# Altium schematic sheet Top_Level.SchDoc: Hierarquia geral / Projeto 3
size 584 x 419 mm; Project: CM5 Photonic Bias Controller; DocumentRev: R5; ProjectRev: R5; Version: Rev R6; SheetNumber: 1; SheetTotal: 17; Author: Carlos Renan; SCH_SCALE: N/A; Address1: UFCG; Address2: Referencia: VIRTUS CC; Address3: Campina Grande - PB; ProjectName: Controle automatico de BIAS para MZM/IQ - Projeto 3; DocumentName: Top_Level.SchDoc
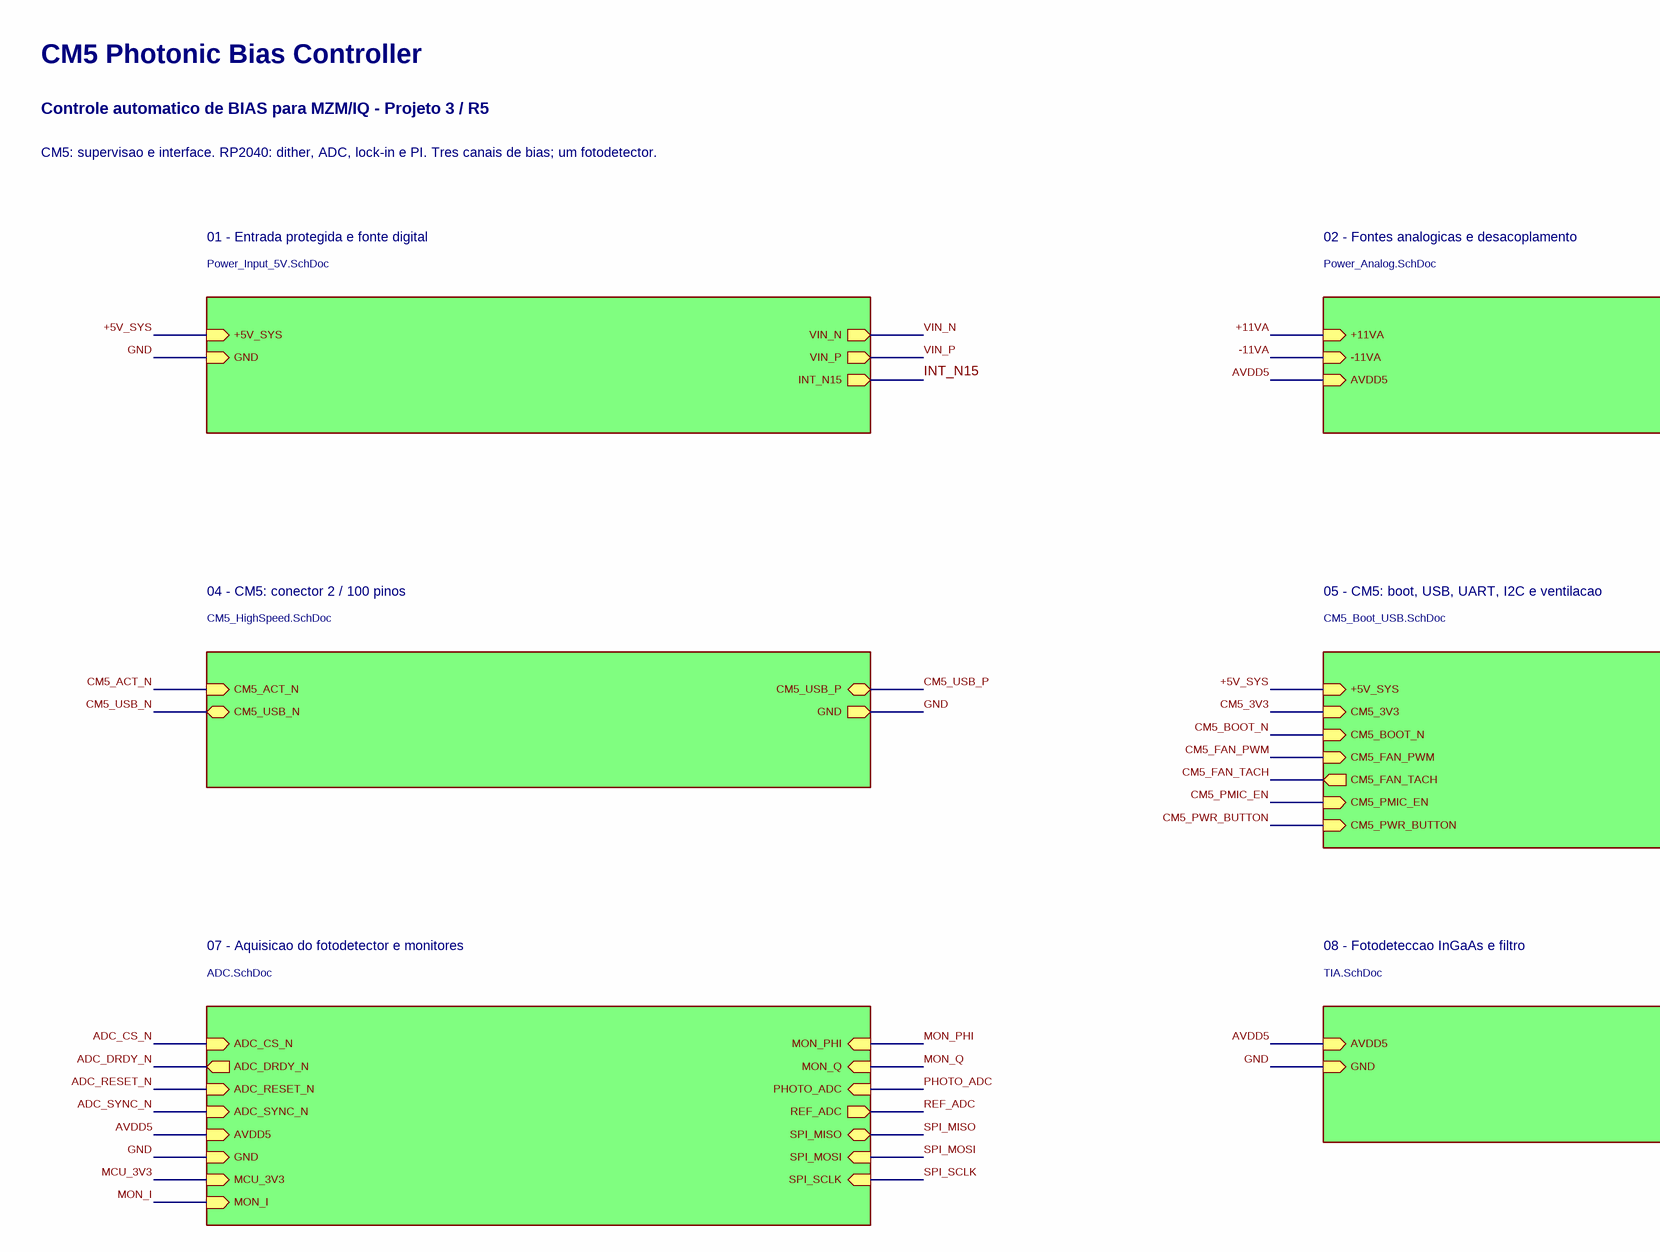
[diagram p0: Top_Level.SchDoc, top left]
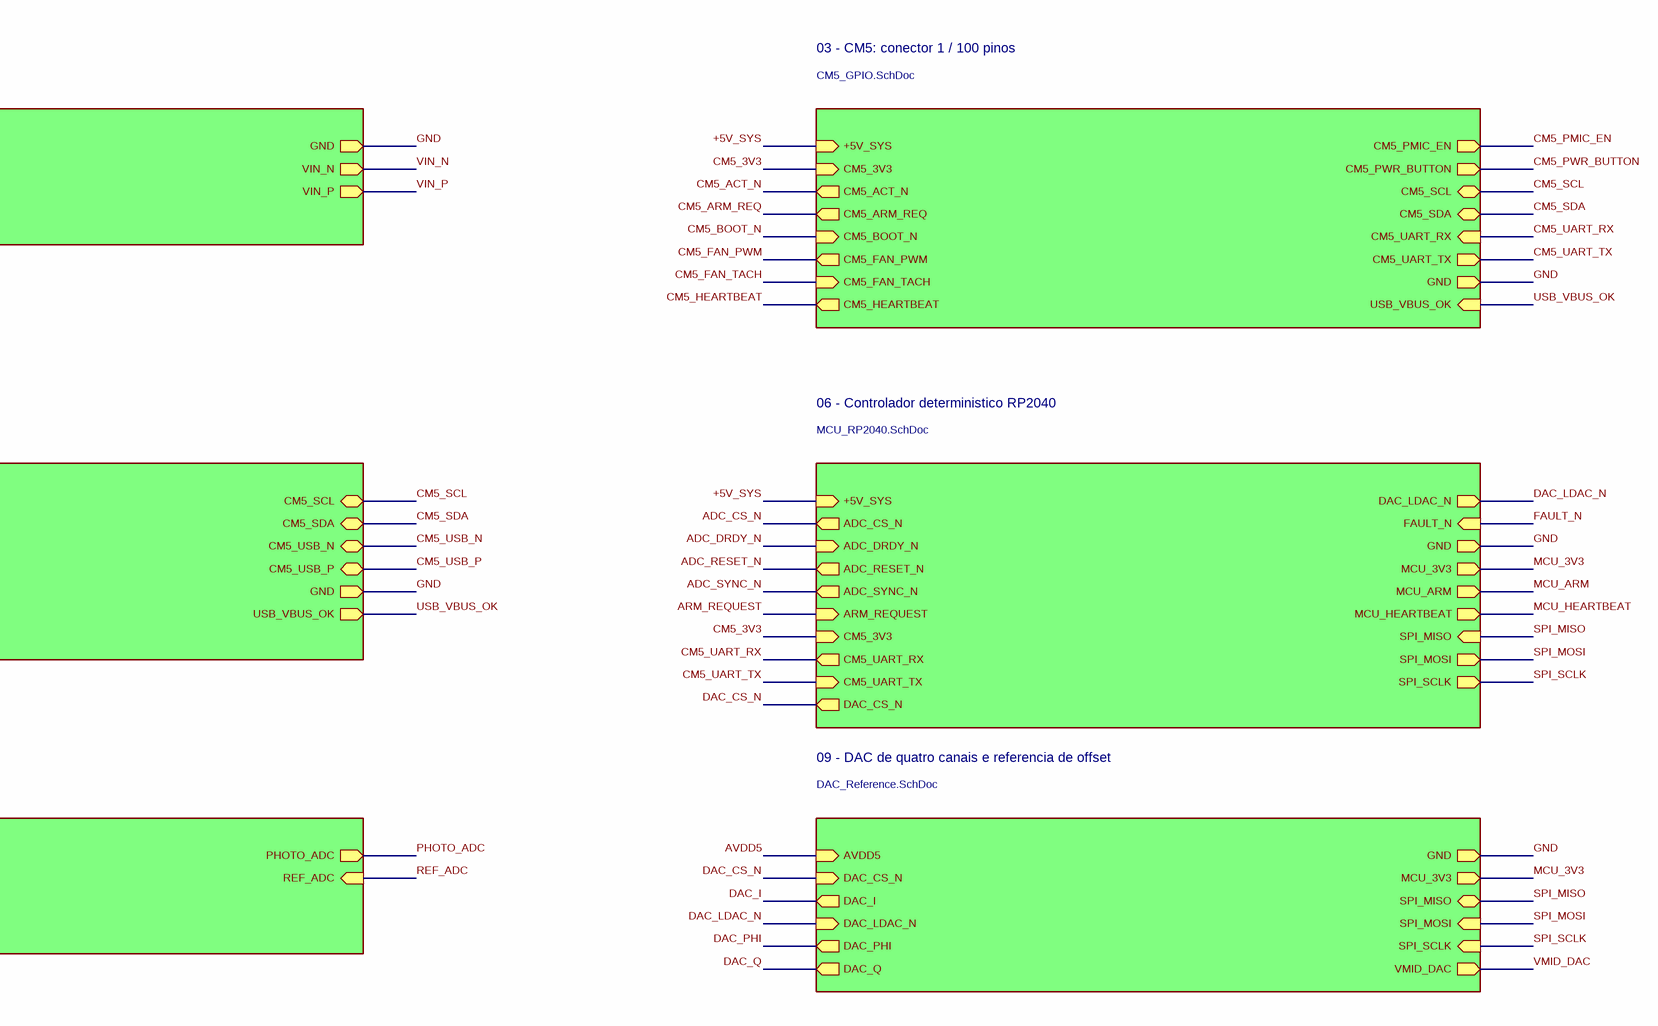
[diagram p1: Top_Level.SchDoc, top right]
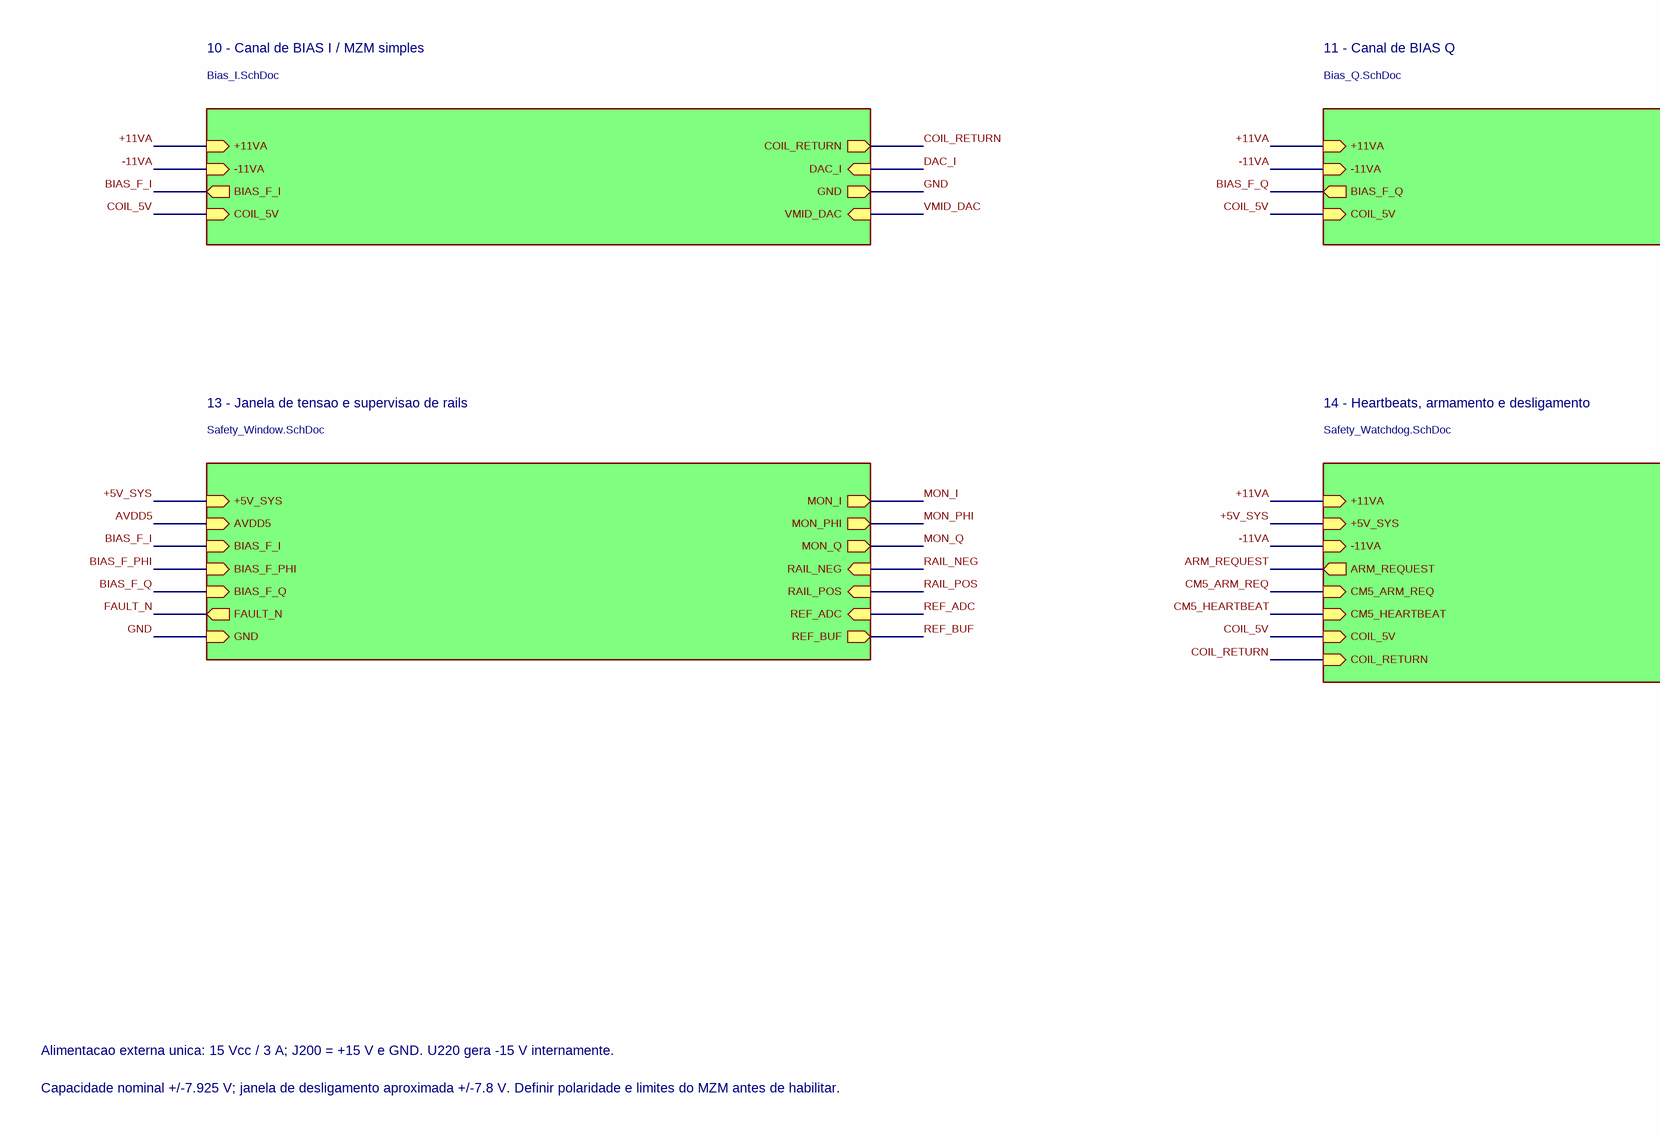
[diagram p2: Top_Level.SchDoc, bottom left]
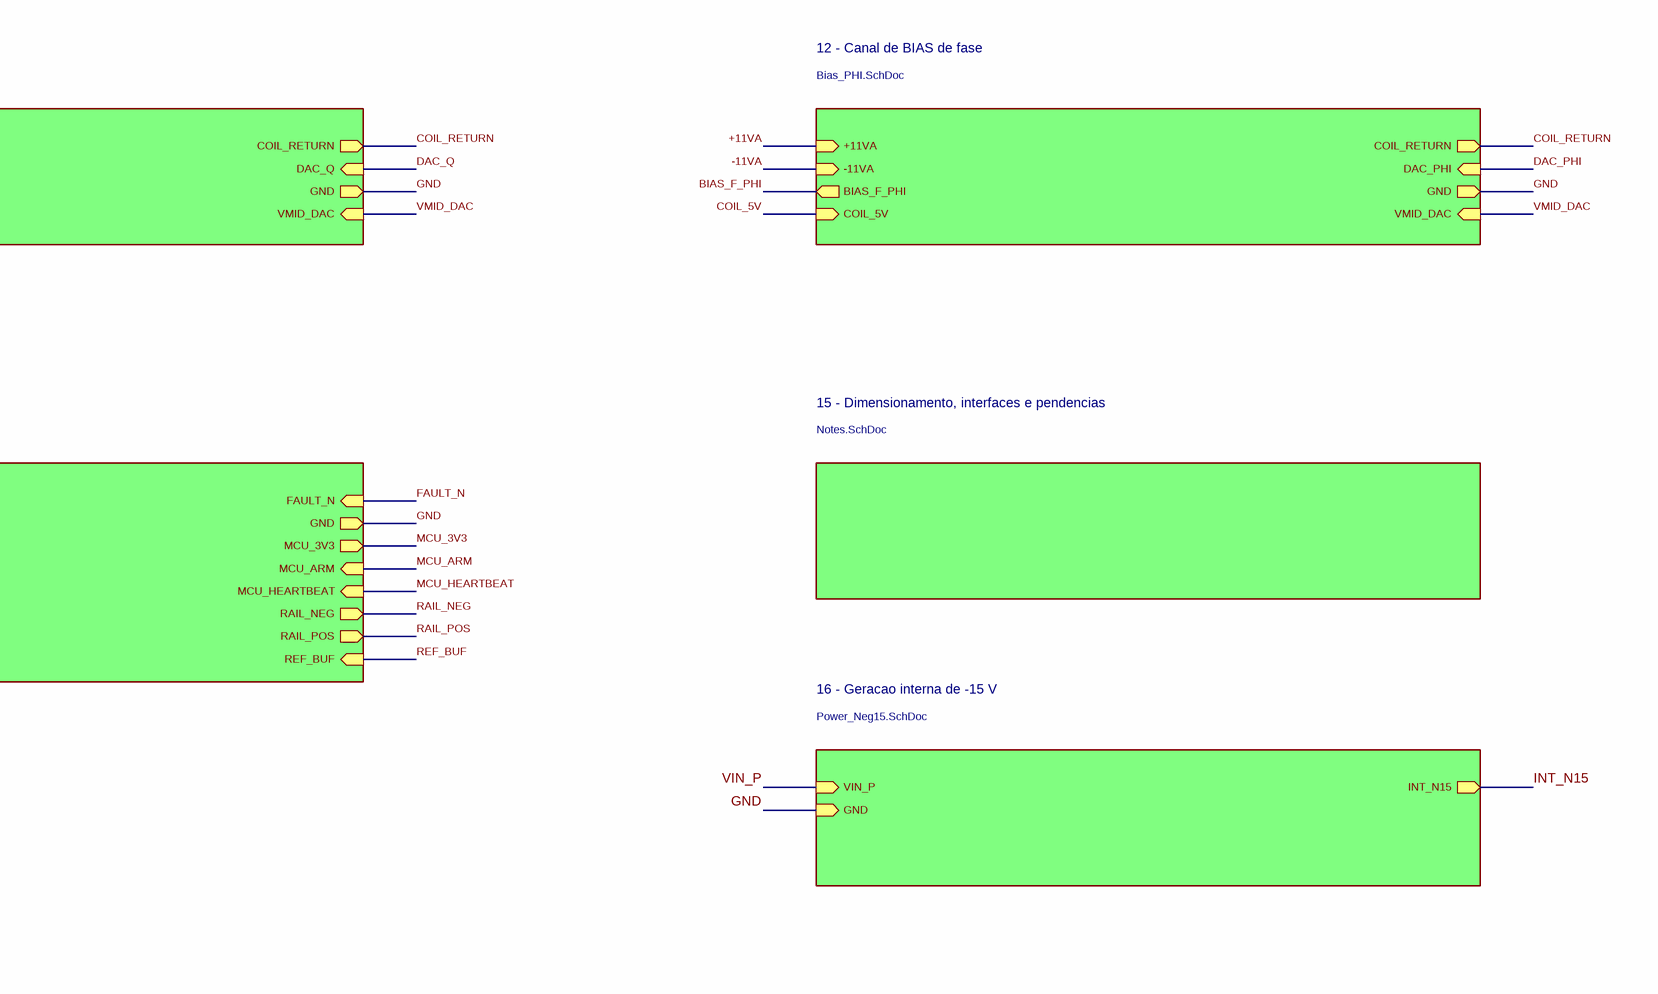
[diagram p3: Top_Level.SchDoc, bottom right]

## Sub-sheets
01 - Entrada protegida e fonte digital = Power_Input_5V.SchDoc: +5V_SYS, GND, VIN_N, VIN_P, INT_N15
02 - Fontes analogicas e desacoplamento = Power_Analog.SchDoc: +11VA, -11VA, AVDD5, GND, VIN_N, VIN_P
03 - CM5: conector 1 / 100 pinos = CM5_GPIO.SchDoc: +5V_SYS, CM5_3V3, CM5_ACT_N (out), CM5_ARM_REQ (out), CM5_BOOT_N, CM5_FAN_PWM (out), CM5_FAN_TACH (in), CM5_HEARTBEAT (out), CM5_PMIC_EN, CM5_PWR_BUTTON, CM5_SCL (bidir), CM5_SDA (bidir), CM5_UART_RX (in), CM5_UART_TX (out), GND, USB_VBUS_OK (in)
04 - CM5: conector 2 / 100 pinos = CM5_HighSpeed.SchDoc: CM5_ACT_N (in), CM5_USB_N (bidir), CM5_USB_P (bidir), GND
05 - CM5: boot, USB, UART, I2C e ventilacao = CM5_Boot_USB.SchDoc: +5V_SYS, CM5_3V3, CM5_BOOT_N, CM5_FAN_PWM (in), CM5_FAN_TACH (out), CM5_PMIC_EN, CM5_PWR_BUTTON, CM5_SCL (bidir), CM5_SDA (bidir), CM5_USB_N (bidir), CM5_USB_P (bidir), GND, USB_VBUS_OK (out)
06 - Controlador deterministico RP2040 = MCU_RP2040.SchDoc: +5V_SYS, ADC_CS_N (out), ADC_DRDY_N (in), ADC_RESET_N (out), ADC_SYNC_N (out), ARM_REQUEST (in), CM5_3V3, CM5_UART_RX (out), CM5_UART_TX (in), DAC_CS_N (out), DAC_LDAC_N (out), FAULT_N (in), GND, MCU_3V3, MCU_ARM (out), MCU_HEARTBEAT (out), SPI_MISO (in), SPI_MOSI (out), SPI_SCLK (out)
07 - Aquisicao do fotodetector e monitores = ADC.SchDoc: ADC_CS_N (in), ADC_DRDY_N (out), ADC_RESET_N (in), ADC_SYNC_N (in), AVDD5, GND, MCU_3V3, MON_I (in), MON_PHI (in), MON_Q (in), PHOTO_ADC (in), REF_ADC (out), SPI_MISO (bidir), SPI_MOSI (in), SPI_SCLK (in)
08 - Fotodeteccao InGaAs e filtro = TIA.SchDoc: AVDD5, GND, PHOTO_ADC (out), REF_ADC (in)
09 - DAC de quatro canais e referencia de offset = DAC_Reference.SchDoc: AVDD5, DAC_CS_N (in), DAC_I (out), DAC_LDAC_N (in), DAC_PHI (out), DAC_Q (out), GND, MCU_3V3, SPI_MISO (bidir), SPI_MOSI (in), SPI_SCLK (in), VMID_DAC (out)
10 - Canal de BIAS I / MZM simples = Bias_I.SchDoc: +11VA, -11VA, BIAS_F_I (out), COIL_5V, COIL_RETURN, DAC_I (in), GND, VMID_DAC (in)
11 - Canal de BIAS Q = Bias_Q.SchDoc: +11VA, -11VA, BIAS_F_Q (out), COIL_5V, COIL_RETURN, DAC_Q (in), GND, VMID_DAC (in)
12 - Canal de BIAS de fase = Bias_PHI.SchDoc: +11VA, -11VA, BIAS_F_PHI (out), COIL_5V, COIL_RETURN, DAC_PHI (in), GND, VMID_DAC (in)
13 - Janela de tensao e supervisao de rails = Safety_Window.SchDoc: +5V_SYS, AVDD5, BIAS_F_I (in), BIAS_F_PHI (in), BIAS_F_Q (in), FAULT_N (out), GND, MON_I (out), MON_PHI (out), MON_Q (out), RAIL_NEG (in), RAIL_POS (in), REF_ADC (in), REF_BUF (out)
14 - Heartbeats, armamento e desligamento = Safety_Watchdog.SchDoc: +11VA, +5V_SYS, -11VA, ARM_REQUEST (out), CM5_ARM_REQ (in), CM5_HEARTBEAT (in), COIL_5V, COIL_RETURN, FAULT_N (in), GND, MCU_3V3, MCU_ARM (in), MCU_HEARTBEAT (in), RAIL_NEG (out), RAIL_POS (out), REF_BUF (in)
15 - Dimensionamento, interfaces e pendencias = Notes.SchDoc: no entries
16 - Geracao interna de -15 V = Power_Neg15.SchDoc: VIN_P, GND, INT_N15

## Nets
+5V_SYS: sheet 01 - Entrada protegida e fonte digital/+5V_SYS, sheet 03 - CM5: conector 1 / 100 pinos/+5V_SYS, sheet 05 - CM5: boot, USB, UART, I2C e ventilacao/+5V_SYS, sheet 06 - Controlador deterministico RP2040/+5V_SYS, sheet 13 - Janela de tensao e supervisao de rails/+5V_SYS, sheet 14 - Heartbeats, armamento e desligamento/+5V_SYS
+11VA: sheet 02 - Fontes analogicas e desacoplamento/+11VA, sheet 10 - Canal de BIAS I / MZM simples/+11VA, sheet 11 - Canal de BIAS Q/+11VA, sheet 12 - Canal de BIAS de fase/+11VA, sheet 14 - Heartbeats, armamento e desligamento/+11VA
-11VA: sheet 02 - Fontes analogicas e desacoplamento/-11VA, sheet 10 - Canal de BIAS I / MZM simples/-11VA, sheet 11 - Canal de BIAS Q/-11VA, sheet 12 - Canal de BIAS de fase/-11VA, sheet 14 - Heartbeats, armamento e desligamento/-11VA
ADC_CS_N: sheet 06 - Controlador deterministico RP2040/ADC_CS_N, sheet 07 - Aquisicao do fotodetector e monitores/ADC_CS_N
ADC_DRDY_N: sheet 06 - Controlador deterministico RP2040/ADC_DRDY_N, sheet 07 - Aquisicao do fotodetector e monitores/ADC_DRDY_N
ADC_RESET_N: sheet 06 - Controlador deterministico RP2040/ADC_RESET_N, sheet 07 - Aquisicao do fotodetector e monitores/ADC_RESET_N
ADC_SYNC_N: sheet 06 - Controlador deterministico RP2040/ADC_SYNC_N, sheet 07 - Aquisicao do fotodetector e monitores/ADC_SYNC_N
ARM_REQUEST: sheet 06 - Controlador deterministico RP2040/ARM_REQUEST, sheet 14 - Heartbeats, armamento e desligamento/ARM_REQUEST
AVDD5: sheet 02 - Fontes analogicas e desacoplamento/AVDD5, sheet 07 - Aquisicao do fotodetector e monitores/AVDD5, sheet 08 - Fotodeteccao InGaAs e filtro/AVDD5, sheet 09 - DAC de quatro canais e referencia de offset/AVDD5, sheet 13 - Janela de tensao e supervisao de rails/AVDD5
BIAS_F_I: sheet 10 - Canal de BIAS I / MZM simples/BIAS_F_I, sheet 13 - Janela de tensao e supervisao de rails/BIAS_F_I
BIAS_F_PHI: sheet 12 - Canal de BIAS de fase/BIAS_F_PHI, sheet 13 - Janela de tensao e supervisao de rails/BIAS_F_PHI
BIAS_F_Q: sheet 11 - Canal de BIAS Q/BIAS_F_Q, sheet 13 - Janela de tensao e supervisao de rails/BIAS_F_Q
CM5_3V3: sheet 03 - CM5: conector 1 / 100 pinos/CM5_3V3, sheet 05 - CM5: boot, USB, UART, I2C e ventilacao/CM5_3V3, sheet 06 - Controlador deterministico RP2040/CM5_3V3
CM5_ACT_N: sheet 03 - CM5: conector 1 / 100 pinos/CM5_ACT_N, sheet 04 - CM5: conector 2 / 100 pinos/CM5_ACT_N
CM5_ARM_REQ: sheet 03 - CM5: conector 1 / 100 pinos/CM5_ARM_REQ, sheet 14 - Heartbeats, armamento e desligamento/CM5_ARM_REQ
CM5_BOOT_N: sheet 03 - CM5: conector 1 / 100 pinos/CM5_BOOT_N, sheet 05 - CM5: boot, USB, UART, I2C e ventilacao/CM5_BOOT_N
CM5_FAN_PWM: sheet 03 - CM5: conector 1 / 100 pinos/CM5_FAN_PWM, sheet 05 - CM5: boot, USB, UART, I2C e ventilacao/CM5_FAN_PWM
CM5_FAN_TACH: sheet 03 - CM5: conector 1 / 100 pinos/CM5_FAN_TACH, sheet 05 - CM5: boot, USB, UART, I2C e ventilacao/CM5_FAN_TACH
CM5_HEARTBEAT: sheet 03 - CM5: conector 1 / 100 pinos/CM5_HEARTBEAT, sheet 14 - Heartbeats, armamento e desligamento/CM5_HEARTBEAT
CM5_PMIC_EN: sheet 03 - CM5: conector 1 / 100 pinos/CM5_PMIC_EN, sheet 05 - CM5: boot, USB, UART, I2C e ventilacao/CM5_PMIC_EN
CM5_PWR_BUTTON: sheet 03 - CM5: conector 1 / 100 pinos/CM5_PWR_BUTTON, sheet 05 - CM5: boot, USB, UART, I2C e ventilacao/CM5_PWR_BUTTON
CM5_SCL: sheet 03 - CM5: conector 1 / 100 pinos/CM5_SCL, sheet 05 - CM5: boot, USB, UART, I2C e ventilacao/CM5_SCL
CM5_SDA: sheet 03 - CM5: conector 1 / 100 pinos/CM5_SDA, sheet 05 - CM5: boot, USB, UART, I2C e ventilacao/CM5_SDA
CM5_UART_RX: sheet 03 - CM5: conector 1 / 100 pinos/CM5_UART_RX, sheet 06 - Controlador deterministico RP2040/CM5_UART_RX
CM5_UART_TX: sheet 03 - CM5: conector 1 / 100 pinos/CM5_UART_TX, sheet 06 - Controlador deterministico RP2040/CM5_UART_TX
CM5_USB_N: sheet 04 - CM5: conector 2 / 100 pinos/CM5_USB_N, sheet 05 - CM5: boot, USB, UART, I2C e ventilacao/CM5_USB_N
CM5_USB_P: sheet 04 - CM5: conector 2 / 100 pinos/CM5_USB_P, sheet 05 - CM5: boot, USB, UART, I2C e ventilacao/CM5_USB_P
COIL_5V: sheet 10 - Canal de BIAS I / MZM simples/COIL_5V, sheet 11 - Canal de BIAS Q/COIL_5V, sheet 12 - Canal de BIAS de fase/COIL_5V, sheet 14 - Heartbeats, armamento e desligamento/COIL_5V
COIL_RETURN: sheet 10 - Canal de BIAS I / MZM simples/COIL_RETURN, sheet 11 - Canal de BIAS Q/COIL_RETURN, sheet 12 - Canal de BIAS de fase/COIL_RETURN, sheet 14 - Heartbeats, armamento e desligamento/COIL_RETURN
DAC_CS_N: sheet 06 - Controlador deterministico RP2040/DAC_CS_N, sheet 09 - DAC de quatro canais e referencia de offset/DAC_CS_N
DAC_I: sheet 09 - DAC de quatro canais e referencia de offset/DAC_I, sheet 10 - Canal de BIAS I / MZM simples/DAC_I
DAC_LDAC_N: sheet 06 - Controlador deterministico RP2040/DAC_LDAC_N, sheet 09 - DAC de quatro canais e referencia de offset/DAC_LDAC_N
DAC_PHI: sheet 09 - DAC de quatro canais e referencia de offset/DAC_PHI, sheet 12 - Canal de BIAS de fase/DAC_PHI
DAC_Q: sheet 09 - DAC de quatro canais e referencia de offset/DAC_Q, sheet 11 - Canal de BIAS Q/DAC_Q
FAULT_N: sheet 06 - Controlador deterministico RP2040/FAULT_N, sheet 13 - Janela de tensao e supervisao de rails/FAULT_N, sheet 14 - Heartbeats, armamento e desligamento/FAULT_N
GND: sheet 01 - Entrada protegida e fonte digital/GND, sheet 02 - Fontes analogicas e desacoplamento/GND, sheet 03 - CM5: conector 1 / 100 pinos/GND, sheet 04 - CM5: conector 2 / 100 pinos/GND, sheet 05 - CM5: boot, USB, UART, I2C e ventilacao/GND, sheet 06 - Controlador deterministico RP2040/GND, sheet 07 - Aquisicao do fotodetector e monitores/GND, sheet 08 - Fotodeteccao InGaAs e filtro/GND, sheet 09 - DAC de quatro canais e referencia de offset/GND, sheet 10 - Canal de BIAS I / MZM simples/GND, sheet 11 - Canal de BIAS Q/GND, sheet 12 - Canal de BIAS de fase/GND, sheet 13 - Janela de tensao e supervisao de rails/GND, sheet 14 - Heartbeats, armamento e desligamento/GND, sheet 16 - Geracao interna de -15 V/GND
INT_N15: sheet 01 - Entrada protegida e fonte digital/INT_N15, sheet 16 - Geracao interna de -15 V/INT_N15
MCU_3V3: sheet 06 - Controlador deterministico RP2040/MCU_3V3, sheet 07 - Aquisicao do fotodetector e monitores/MCU_3V3, sheet 09 - DAC de quatro canais e referencia de offset/MCU_3V3, sheet 14 - Heartbeats, armamento e desligamento/MCU_3V3
MCU_ARM: sheet 06 - Controlador deterministico RP2040/MCU_ARM, sheet 14 - Heartbeats, armamento e desligamento/MCU_ARM
MCU_HEARTBEAT: sheet 06 - Controlador deterministico RP2040/MCU_HEARTBEAT, sheet 14 - Heartbeats, armamento e desligamento/MCU_HEARTBEAT
MON_I: sheet 07 - Aquisicao do fotodetector e monitores/MON_I, sheet 13 - Janela de tensao e supervisao de rails/MON_I
MON_PHI: sheet 07 - Aquisicao do fotodetector e monitores/MON_PHI, sheet 13 - Janela de tensao e supervisao de rails/MON_PHI
MON_Q: sheet 07 - Aquisicao do fotodetector e monitores/MON_Q, sheet 13 - Janela de tensao e supervisao de rails/MON_Q
PHOTO_ADC: sheet 07 - Aquisicao do fotodetector e monitores/PHOTO_ADC, sheet 08 - Fotodeteccao InGaAs e filtro/PHOTO_ADC
RAIL_NEG: sheet 13 - Janela de tensao e supervisao de rails/RAIL_NEG, sheet 14 - Heartbeats, armamento e desligamento/RAIL_NEG
RAIL_POS: sheet 13 - Janela de tensao e supervisao de rails/RAIL_POS, sheet 14 - Heartbeats, armamento e desligamento/RAIL_POS
REF_ADC: sheet 07 - Aquisicao do fotodetector e monitores/REF_ADC, sheet 08 - Fotodeteccao InGaAs e filtro/REF_ADC, sheet 13 - Janela de tensao e supervisao de rails/REF_ADC
REF_BUF: sheet 13 - Janela de tensao e supervisao de rails/REF_BUF, sheet 14 - Heartbeats, armamento e desligamento/REF_BUF
SPI_MISO: sheet 06 - Controlador deterministico RP2040/SPI_MISO, sheet 07 - Aquisicao do fotodetector e monitores/SPI_MISO, sheet 09 - DAC de quatro canais e referencia de offset/SPI_MISO
SPI_MOSI: sheet 06 - Controlador deterministico RP2040/SPI_MOSI, sheet 07 - Aquisicao do fotodetector e monitores/SPI_MOSI, sheet 09 - DAC de quatro canais e referencia de offset/SPI_MOSI
SPI_SCLK: sheet 06 - Controlador deterministico RP2040/SPI_SCLK, sheet 07 - Aquisicao do fotodetector e monitores/SPI_SCLK, sheet 09 - DAC de quatro canais e referencia de offset/SPI_SCLK
USB_VBUS_OK: sheet 03 - CM5: conector 1 / 100 pinos/USB_VBUS_OK, sheet 05 - CM5: boot, USB, UART, I2C e ventilacao/USB_VBUS_OK
VIN_N: sheet 01 - Entrada protegida e fonte digital/VIN_N, sheet 02 - Fontes analogicas e desacoplamento/VIN_N
VIN_P: sheet 01 - Entrada protegida e fonte digital/VIN_P, sheet 02 - Fontes analogicas e desacoplamento/VIN_P, sheet 16 - Geracao interna de -15 V/VIN_P
VMID_DAC: sheet 09 - DAC de quatro canais e referencia de offset/VMID_DAC, sheet 10 - Canal de BIAS I / MZM simples/VMID_DAC, sheet 11 - Canal de BIAS Q/VMID_DAC, sheet 12 - Canal de BIAS de fase/VMID_DAC

## Notes on the sheet
- CM5 Photonic Bias Controller
- Controle automatico de BIAS para MZM/IQ - Projeto 3 / R5
- CM5: supervisao e interface. RP2040: dither, ADC, lock-in e PI. Tres canais de bias; um fotodetector.
- Alimentacao externa unica: 15 Vcc / 3 A; J200 = +15 V e GND. U220 gera -15 V internamente.
- Capacidade nominal +/-7.925 V; janela de desligamento aproximada +/-7.8 V. Definir polaridade e limites do MZM antes de habilitar.
- REVISION
- DESCRIPTION
- DATE
- APPROVED
- ADDRESS
- PROJECT
- VERSION
- TITLE
- A2
- SIZE
- SCALE
- DOCUMENT NAME:
- DOCUMENT REVISION:
- OF
- SHEET:
- PROJECT REVISION: